# EAGLE schematic lab03 (EAGLE 9.6.2)
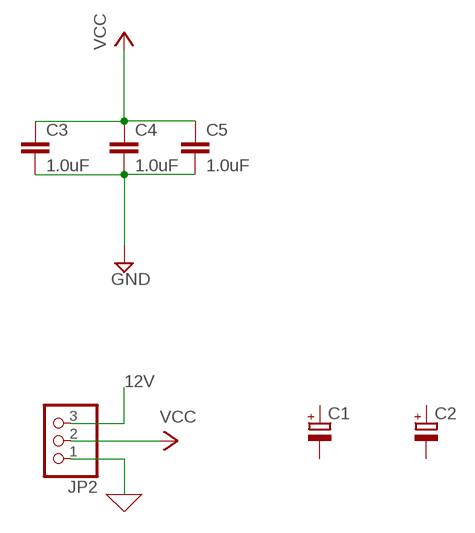
[diagram p0: schematic, sheet 1]

## Parts
C1  CPOL-EUE2,5-6E  [E2,5-6E]
C2  CPOL-EUE2,5-6E  [E2,5-6E]
C3  1.0uF  1.0UF-0805-25V-(+80/-20%)  [0805]
C4  1.0uF  1.0UF-0805-25V-(+80/-20%)  [0805]
C5  1.0uF  1.0UF-0805-25V-(+80/-20%)  [0805]
JP2  PINHD-1X3  [1X03]

## Nets
0: JP2.1 ; supply symbol labelled GND
12V: JP2.3
GND: C3.2 C4.2 C5.2
VCC: C3.1 C4.1 C5.1 JP2.2
Unconnected: C1.+ C1.- C2.+ C2.-

## Library data of the parts
C1 C2 = rcl:CPOL-EU: POLARIZED CAPACITOR, European symbol; SPICEPREFIX: C
C3-C5 = SparkFun-Capacitors:1.0UF: 1µF ceramic capacitors A capacitor is a passive two-terminal electrical component used to store electrical energy temporarily in an electric field.; PROD_ID: CAP-11625
JP2 = pinhead:PINHD-1X3: PIN HEADER